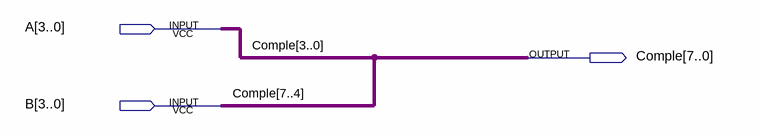
[diagram p0: schematic sheet]
// Quartus schematic 4_to_8_bus.bdf as structural Verilog: 0 symbols, 3 pins
module \4_to_8_bus  (
  input  [3:0] A,
  input  [3:0] B,
  output [7:0] Comple
);


  assign Comple = {B, A};
endmodule
